# Altium project TYPEC_4KTransmitter-v1.0.PrjPcb (part 9 of 11)

## Sheet eMMC_SPI-FLASH_SHEET.SchDoc
size A4; SheetNumber: 19; SheetTotal: 23
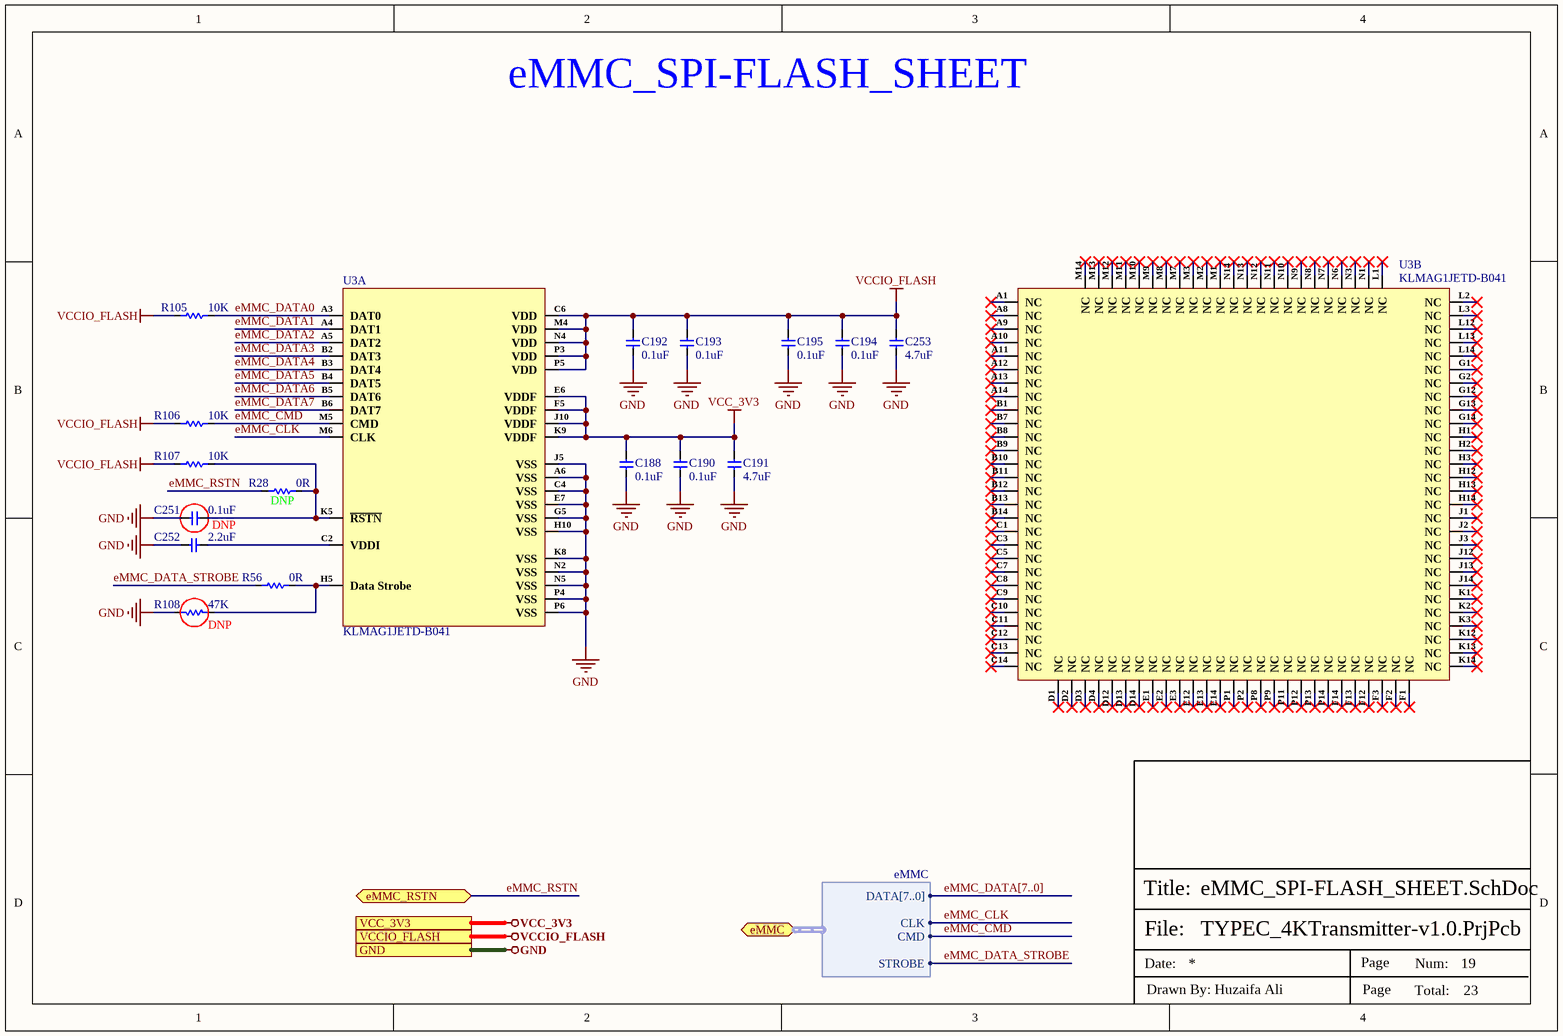
[diagram p19: eMMC_SPI-FLASH_SHEET.SchDoc]

### Parts
C188  0.1uF  [Cap-0402]
C190  0.1uF  [Cap-0402]
C191  4.7uF  [Cap-0402]
C192  0.1uF  [Cap-0402]
C193  0.1uF  [Cap-0402]
C194  0.1uF  [Cap-0402]
C195  0.1uF  [Cap-0402]
C251  0.1uF  [Cap-0402]
C252  2.2uF  [Cap-0402]
C253  4.7uF  [Cap-0402]
R28  DNP  [Res-0402]
R56  0R  [Res-0402]
R105  10K  [Res-0402]
R106  10K  [Res-0402]
R107  10K  [Res-0402]
R108  47K  [Res-0402]
U3  KLMAG1JETD-B041  [FBGA-153(11.5x13)]  (parts A,B of 2)

### Ports
eMMC (bidir, harness eMMC, see RK3566_FLASH-SD_SHEET[2C]), eMMC_RSTN (bidir, see RK3566_FLASH-SD_SHEET[2B]), GND (see DRAM_LPDDR4_SHEET[6D], HDMI2.0_SHEET[3D], POWER_LDO_SHEET[3D], POWER_OTHER_SHEET[3C], POWER_PMIC_RK809_CODEC[3C], POWER_PMIC_RK809_DC DC[3D], POWER_PMIC_RK809_LDO[4C], POWER_PMIC_RK809_MGM[3D], RK3566_AUDIO_SHEET[3C], RK3566_DDR-PHY_SHEET[5D], RK3566_FLASH-SD_SHEET[4C], RK3566_OSC_PMUIO_SHEET[5D], RK3566_POWER_SHEET[3D], RK3566_SARADC_GPIO[3D], RK3566_USB_PCIe_SHEET[3D], RK3566_VI_SHEET[3D], RK3566_VO_SHEET_1[3C], RK3566_VO_SHEET_2[4C], TYPE-C_INTERFACE_SHEET[3D], TYPE-C_TO_MIPI-CSI_SHEET[5D], USB2.0_SHEET[3D], WIFI-6_SHEET[3D]), VCC_3V3 (see HDMI2.0_SHEET[3D], POWER_PMIC_RK809_LDO[4C], RK3566_AUDIO_SHEET[3C], RK3566_SARADC_GPIO[3D], RK3566_USB_PCIe_SHEET[3D], RK3566_VI_SHEET[3D], RK3566_VO_SHEET_2[4C], TYPE-C_TO_MIPI-CSI_SHEET[5D], WIFI-6_SHEET[3D]), VCCIO_FLASH (see RK3566_FLASH-SD_SHEET[4C])

### Harnesses
eMMC: DATA[7..0], STROBE, CLK, CMD

### Nets
GND: C188.1 C190.1 C191.1 C192.1 C193.1 C194.1 C195.1 C251.2 C252.1 C253.1 R108.1 U3.A6(VSS) U3.C4(VSS) U3.E7(VSS) U3.G5(VSS) U3.H10(VSS) U3.J5(VSS) U3.K8(VSS) U3.N2(VSS) U3.N5(VSS) U3.P4(VSS) U3.P6(VSS) ; port GND
VCC_3V3: C188.2 C190.2 C191.2 U3.E6(VDDF) U3.F5(VDDF) U3.J10(VDDF) U3.K9(VDDF) ; port VCC_3V3
VCCIO_FLASH: C192.2 C193.2 C194.2 C195.2 C253.2 R105.1 R106.1 R107.1 U3.C6(VDD) U3.M4(VDD) U3.N4(VDD) U3.P3(VDD) U3.P5(VDD) ; port VCCIO_FLASH
eMMC_CLK: U3.M6(CLK) ; port eMMC.CLK
eMMC_CMD: R106.2 U3.M5(CMD) ; port eMMC.CMD
eMMC_DATA0: R105.2 U3.A3(DAT0)
eMMC_DATA1: U3.A4(DAT1)
eMMC_DATA2: U3.A5(DAT2)
eMMC_DATA3: U3.B2(DAT3)
eMMC_DATA4: U3.B3(DAT4)
eMMC_DATA5: U3.B4(DAT5)
eMMC_DATA6: U3.B5(DAT6)
eMMC_DATA7: U3.B6(DAT7)
eMMC_DATA_STROBE: R56.1 ; port eMMC.STROBE
eMMC_RSTN: R28.1 ; port eMMC_RSTN
NetC251_1: C251.1 R28.2 R107.2 U3.K5(~{RSTN})
NetC252_2: C252.2 U3.C2(VDDI)
NetR56_2: R56.2 R108.2 U3.H5(Data_Strobe)

Not connected (* = marked no-connect by the designer): U3 A1(NC)* A8(NC)* A9(NC)* A10(NC)* A11(NC)* A12(NC)* A13(NC)* A14(NC)* B1(NC)* B7(NC)* B8(NC)* B9(NC)* B10(NC)* B11(NC)* B12(NC)* B13(NC)* B14(NC)* C1(NC)* C3(NC)* C5(NC)* C7(NC)* C8(NC)* C9(NC)* C10(NC)* C11(NC)* C12(NC)* C13(NC)* C14(NC)* D1(NC)* D2(NC)* D3(NC)* D4(NC)* D12(NC)* D13(NC)* D14(NC)* E1(NC)* E2(NC)* E3(NC)* E12(NC)* E13(NC)* E14(NC)* F1(NC)* F2(NC)* F3(NC)* F12(NC)* F13(NC)* F14(NC)* G1(NC)* G2(NC)* G12(NC)* G13(NC)* G14(NC)* H1(NC)* H2(NC)* H3(NC)* H12(NC)* H13(NC)* H14(NC)* J1(NC)* J2(NC)* J3(NC)* J12(NC)* J13(NC)* J14(NC)* K1(NC)* K2(NC)* K3(NC)* K12(NC)* K13(NC)* K14(NC)* L1(NC)* L2(NC)* L3(NC)* L12(NC)* L13(NC)* L14(NC)* M1(NC)* M2(NC)* M3(NC)* M7(NC)* M8(NC)* M9(NC)* M10(NC)* M11(NC)* M12(NC)* M13(NC)* M14(NC)* N1(NC)* N3(NC)* N6(NC)* N7(NC)* N8(NC)* N9(NC)* N10(NC)* N11(NC)* N12(NC)* N13(NC)* N14(NC)* P1(NC)* P2(NC)* P8(NC)* P9(NC)* P11(NC)* P12(NC)* P13(NC)* P14(NC)*

### Buses and harness runs
bus eMMC_DATA[7..0]

### Notes on the sheet
- eMMC_SPI-FLASH_SHEET
- (near R28) 0R
- DNP
- (near R108) DNP
- File:
- Title:
- Date:
- Page
- Num:
- Total:
- Drawn By: Huzaifa Ali

### Library data of the parts
C188 C190 C192-C195 C251 = CC0402KRX5R6BB104: as C178 on sheet DRAM_LPDDR4_SHEET; Supplier 1: Digi-Key; Manufacturer Part Number: CC0402KRX5R6BB104; RoHS: Yes; Category: Ceramic Capacitors; Stock 1: 6385580; Pricing 1: 1=0.10000, 10=0.02700, 50=0.01500, 100=0.01220, 500=0.00874, 1000=0.00687, 2500=0.00625, 5000=0.00575 (USD); Mount: Surface Mount; Case/Package: 0402; Number of Pins: 2; Case Code (Imperial): 0402; Case Code (Metric): 1005; Min Operating Temperature: -55°C; Max Operating Temperature: 85°C; Dielectric: X5R; Packaging: Tape and Reel; Voltage Rating: 10V; Package Quantity: 1; Termination: SMD/SMT; Voltage Rating (DC): 10V; Series: CC; Length: 1mm; Width: 0.02inch; Height: 0.5mm; Depth: 0.5mm; Thickness: 0.022inch; Radiation Hardening: No; RoHS Compliant: Yes; REACH SVHC: No SVHC; Lead Free: Lead Free; Halogen Free: Halogen Free; ComponentLink1URL: https://datasheet.ciiva.com/144/mlccorderingcode-144029.pdf?src-supplier=Digi-Key; ComponentLink1Description: https://datasheet.ciiva.com/144/mlccorderingcode-144029.pdf?src-supplier=Digi-Key; ComponentLink2URL: https://datasheet.ciiva.com/144/mlccorderingcode-144028.pdf?src-supplier=Digi-Key; ComponentLink2Description: https://datasheet.ciiva.com/144/mlccorderingcode-144028.pdf?src-supplier=Digi-Key; ComponentLink3URL: https://datasheet.ciiva.com/144/mlccorderingcode-144030.pdf?src-supplier=Digi-Key; ComponentLink3Description: https://datasheet.ciiva.com/144/mlccorderingcode-144030.pdf?src-supplier=Digi-Key; ComponentLink4URL: https://datasheet.ciiva.com/7978/1359354-7978091.pdf?src-supplier=Element14; ComponentLink4Description: https://datasheet.ciiva.com/7978/1359354-7978091.pdf?src-supplier=Element14; ComponentLink5URL: https://datasheet.ciiva.com/11587/upy-gphc-x5r-4v-to-50v-12-11587302.pdf?src-supplier=Avnet; ComponentLink5Description: https://datasheet.ciiva.com/11587/upy-gphc-x5r-4v-to-50v-12-11587302.pdf?src-supplier=Avnet; Supplier Part Number 1: 311-1336-1-ND; LCSC Part Number: C129131
C191 C253 = CC0402KRX5R6BB475: CAP CER 4.7UF 10V X5R 0402; Manufacturer: Yageo; Tolerance: 10%; Supplier 1: Farnell; Manufacturer Part Number: CC0402KRX5R6BB475; RoHS: Yes; Category: Ceramic Capacitors; Stock 1: 20000; Pricing 1: 10000=0.02310, 50000=0.02100 (GBP); Mount: Surface Mount; Case/Package: 0402; Case Code (Imperial): 0402; Case Code (Metric): 1005; Min Operating Temperature: -55°C; Max Operating Temperature: 85°C; Packaging: Cut Tape; Capacitance: 4.7uF; Voltage Rating: 10V; RoHS Compliant: Yes; ComponentLink1URL: http://www.yageo.com/documents/recent/UPY-GPHC_X5R_4V-to-50V_25.pdf?src-supplier=Digi-Key; ComponentLink1Description: http://www.yageo.com/documents/recent/UPY-GPHC_X5R_4V-to-50V_25.pdf?src-supplier=Digi-Key; Supplier Part Number 1: 3871698; LCSC Part Number: C326586
C252 = C1005X5R0J225KTJA0E: CAP CER 2.2UF 6.3V X5R 0402; Manufacturer: TDK; Item Type: Capacitor; LCSC Part Number: C343036; Manufacturer Part Number: C1005X5R0J225KTJA0E; ComponentLink1Description: LCSC; ComponentLink1URL: https://www.lcsc.com/product-detail/Multilayer-Ceramic-Capacitors-MLCC-SMD-SMT_TDK-C1005X5R0J225KTJA0E_C343036.html
R28 = RC0402FR-070RL: RES 0 OHM JUMPER 1/16W 0402; Manufacturer: Yageo; Item Type: Resistors; Resistance: 0R; Tolerance: 1%; Power Rating: 62.5mW; Voltage Rating: 50V; Temperature Coefficient: 200ppm/°C; Max Power Dissipation: 63mW; Supplier 1: Mouser; Manufacturer Part Number: RC0402FR-070RL; RoHS: Yes; Stock 1: 8556842; Pricing 1: 1=0.10000, 10=0.01400, 50=0.01400, 100=0.00600, 1000=0.00300, 5000=0.00200, 10000=0.00100 (USD); Mount: Surface Mount; Case/Package: 0402; Contact Plating: Tin,Matte; Case Code (Imperial): 0402; Case Code (Metric): 1005; Size Code: 0402; Min Operating Temperature: -55°C; Max Operating Temperature: 155°C; Resistor Type: Thick Film; Packaging: Tape and Reel; Termination: SMD/SMT; Features: Moisture Resistant; Series: RC; Number of Terminations: 2; Length: 1mm; Width: 0.5mm; Height: 0.35mm; Radiation Hardening: No; Lead Free: Lead Free; RoHS Compliant: Yes; ComponentLink1URL: https://datasheet.ciiva.com/8896/pyu-rc0402-51-rohs-l-6-8896149.pdf?src-supplier=Avnet; ComponentLink1Description: https://datasheet.ciiva.com/8896/pyu-rc0402-51-rohs-l-6-8896149.pdf?src-supplier=Avnet; ComponentLink2URL: https://datasheet.ciiva.com/16790/pyu-rc0402-51-rohs-l-6-r-16790444.pdf?src-supplier=Future+Electronics; ComponentLink2Description: https://datasheet.ciiva.com/16790/pyu-rc0402-51-rohs-l-6-r-16790444.pdf?src-supplier=Future+Electronics; Supplier Part Number 1: 603-RC0402FR-070RL; LCSC Part Number: C106231
R56 = RC0402FR-070RL: as R29 on sheet RK3566_VO_SHEET_2; Supplier 1: Mouser; Manufacturer Part Number: RC0402FR-070RL; RoHS: Yes; Stock 1: 8556842; Pricing 1: 1=0.10000, 10=0.01400, 50=0.01400, 100=0.00600, 1000=0.00300, 5000=0.00200, 10000=0.00100 (USD); Mount: Surface Mount; Case/Package: 0402; Contact Plating: Tin,Matte; Case Code (Imperial): 0402; Case Code (Metric): 1005; Size Code: 0402; Min Operating Temperature: -55°C; Max Operating Temperature: 155°C; Resistance: 0R; Resistor Type: Thick Film; Packaging: Tape and Reel; Termination: SMD/SMT; Features: Moisture Resistant; Series: RC; Number of Terminations: 2; Length: 1mm; Width: 0.5mm; Height: 0.35mm; Radiation Hardening: No; Lead Free: Lead Free; RoHS Compliant: Yes; ComponentLink1URL: https://datasheet.ciiva.com/8896/pyu-rc0402-51-rohs-l-6-8896149.pdf?src-supplier=Avnet; ComponentLink1Description: https://datasheet.ciiva.com/8896/pyu-rc0402-51-rohs-l-6-8896149.pdf?src-supplier=Avnet; ComponentLink2URL: https://datasheet.ciiva.com/16790/pyu-rc0402-51-rohs-l-6-r-16790444.pdf?src-supplier=Future+Electronics; ComponentLink2Description: https://datasheet.ciiva.com/16790/pyu-rc0402-51-rohs-l-6-r-16790444.pdf?src-supplier=Future+Electronics; Supplier Part Number 1: 603-RC0402FR-070RL; LCSC Part Number: C106231
R105-R107 = RC0402FR-0710KL: RES 10K OHM 1% 1/16W 0402; Manufacturer: Yageo; Resistance: 10kR; Voltage Rating (DC): 50V; Temperature Coefficient: 100ppm/°C; Power Rating: 62.5mW; Max Power Dissipation: 63mW; Item Type: Resistor; Supplier 1: Mouser; Manufacturer Part Number: RC0402FR-0710KL; RoHS: Yes; Category: Chip SMD Resistors; Stock 1: 18648329; Pricing 1: 1=0.10000, 10=0.01400, 50=0.01400, 100=0.00500, 1000=0.00300, 10000=0.00200 (USD); Case/Package: 0402; Number of Pins: 2; Case Code (Imperial): 0402; Case Code (Metric): 1005; Min Operating Temperature: -55°C; Max Operating Temperature: 155°C; Resistor Type: Thick Film; Tolerance: 1%; Packaging: Tape and Reel; Voltage Rating: 50V; Termination: SMD/SMT; Working Voltage: 50V; Number of Terminations: 2; Features: Moisture Resistant; Series: RC; Resistance Tolerance: 1%; Construction: Rectangular; Length: 1mm; Width: 0.5mm; Height: 0.32mm; Depth: 0.5mm; Lead Pitch: 0.2mm; REACH SVHC: No SVHC; Lead Free: Lead Free; RoHS Compliant: Yes; Military Standard: Not; ComponentLink1URL: https://datasheet.ciiva.com/7660/38568-7660787.pdf?src-supplier=Element14; ComponentLink1Description: https://datasheet.ciiva.com/7660/38568-7660787.pdf?src-supplier=Element14; ComponentLink2URL: https://datasheet.ciiva.com/7849/1686128-7849814.pdf?src-supplier=Element14; ComponentLink2Description: https://datasheet.ciiva.com/7849/1686128-7849814.pdf?src-supplier=Element14; ComponentLink3URL: https://datasheet.ciiva.com/7983/1018594-7983486.pdf?src-supplier=Element14; ComponentLink3Description: https://datasheet.ciiva.com/7983/1018594-7983486.pdf?src-supplier=Element14; ComponentLink4URL: https://datasheet.ciiva.com/22747/1018594-22747512.pdf?src-supplier=Element14; ComponentLink4Description: https://datasheet.ciiva.com/22747/1018594-22747512.pdf?src-supplier=Element14; ComponentLink5URL: https://datasheet.ciiva.com/12667/pyu-rc0402-51-rohs-l-6-r-12667067.pdf?src-supplier=Mouser; ComponentLink5Description: https://datasheet.ciiva.com/12667/pyu-rc0402-51-rohs-l-6-r-12667067.pdf?src-supplier=Mouser; ComponentLink6URL: https://datasheet.ciiva.com/7849/1784430-7849813.pdf?src-supplier=Element14; ComponentLink6Description: https://datasheet.ciiva.com/7849/1784430-7849813.pdf?src-supplier=Element14; ComponentLink7URL: https://datasheet.ciiva.com/7849/1784430-7849815.pdf?src-supplier=Element14; ComponentLink7Description: https://datasheet.ciiva.com/7849/1784430-7849815.pdf?src-supplier=Element14; Supplier Part Number 1: 603-RC0402FR-0710KL; LCSC Part Number: C60490
R108 = RC0402FR-0747KL: RES 47K OHM 1% 1/16W 0402; Manufacturer: Yageo; Resistance: 47kR; Temperature Coefficient: 100ppm/°C; Voltage Rating: 50V; Power Rating: 62.5mW; Max Power Dissipation: 63mW; Item Type: Resistor; Supplier 1: Avnet; Manufacturer Part Number: RC0402FR-0747KL; RoHS: Yes; Category: Chip SMD Resistors; Stock 1: 680000; Pricing 1: 10000=0.00085, 20000=0.00087, 40000=0.00084, 60000=0.00083, 80000=0.00079, 100000=0.00078, 1000000=0.00076 (USD); Case/Package: 0402; Case Code (Imperial): 0402; Case Code (Metric): 1005; Min Operating Temperature: -55°C; Max Operating Temperature: 155°C; Resistor Type: Thick Film; Tolerance: 1%; Packaging: Tape and Reel; Termination: SMD/SMT; Number of Terminations: 2; Features: Moisture Resistant; Series: RC; Resistance Tolerance: 1%; Construction: Rectangular; Length: 1mm; Width: 0.02inch; Height: 0.016inch; Depth: 0.5mm; Lead Free: Lead Free; RoHS Compliant: Yes; Military Standard: Not; ComponentLink1URL: https://datasheet.ciiva.com/46412/1018594-46412839.pdf?src-supplier=Element14; ComponentLink1Description: https://datasheet.ciiva.com/46412/1018594-46412839.pdf?src-supplier=Element14; ComponentLink2URL: https://datasheet.ciiva.com/2453/pyu-r-int-thick-7-2453389.pdf?src-supplier=Digi-Key; ComponentLink2Description: https://datasheet.ciiva.com/2453/pyu-r-int-thick-7-2453389.pdf?src-supplier=Digi-Key; ComponentLink3URL: https://datasheet.ciiva.com/2453/pyu-r-int-thick-7-2453390.pdf?src-supplier=Digi-Key; ComponentLink3Description: https://datasheet.ciiva.com/2453/pyu-r-int-thick-7-2453390.pdf?src-supplier=Digi-Key; ComponentLink4URL: https://datasheet.ciiva.com/2453/pyu-r-int-thick-7-2453388.pdf?src-supplier=Digi-Key; ComponentLink4Description: https://datasheet.ciiva.com/2453/pyu-r-int-thick-7-2453388.pdf?src-supplier=Digi-Key; ComponentLink5URL: https://datasheet.ciiva.com/15189/getdatasheetpartid-323748-15189466.pdf?src-supplier=Verical; ComponentLink5Description: https://datasheet.ciiva.com/15189/getdatasheetpartid-323748-15189466.pdf?src-supplier=Verical; ComponentLink6URL: https://datasheet.ciiva.com/16793/pyu-rc0402-51-rohs-l-6-r-16793430.pdf?src-supplier=Future+Electronics; ComponentLink6Description: https://datasheet.ciiva.com/16793/pyu-rc0402-51-rohs-l-6-r-16793430.pdf?src-supplier=Future+Electronics; Supplier Part Number 1: RC0402FR-0747KL; LCSC Part Number: C93943; Size Code: 0402; Package Quantity: 1
U3 = KLMAG1JETD-B041: eMMC 5.1 FBGA-153 eMMC ROHS; Manufacturer: Samsung; Item Type: IC; Manufacturer Part Number: KLMAG1JETD-B041; Package: FBGA-153; LCSC Part Number: C499919; ComponentLink1Description: LCSC; ComponentLink1URL: https://www.lcsc.com/product-detail/eMMC_Samsung-KLMAG1JETD-B041_C499919.html

## Sheet TYPE-C_TO_MIPI-CSI_SHEET.SchDoc
size 420 x 297 mm; SheetNumber: 20; SheetTotal: 23
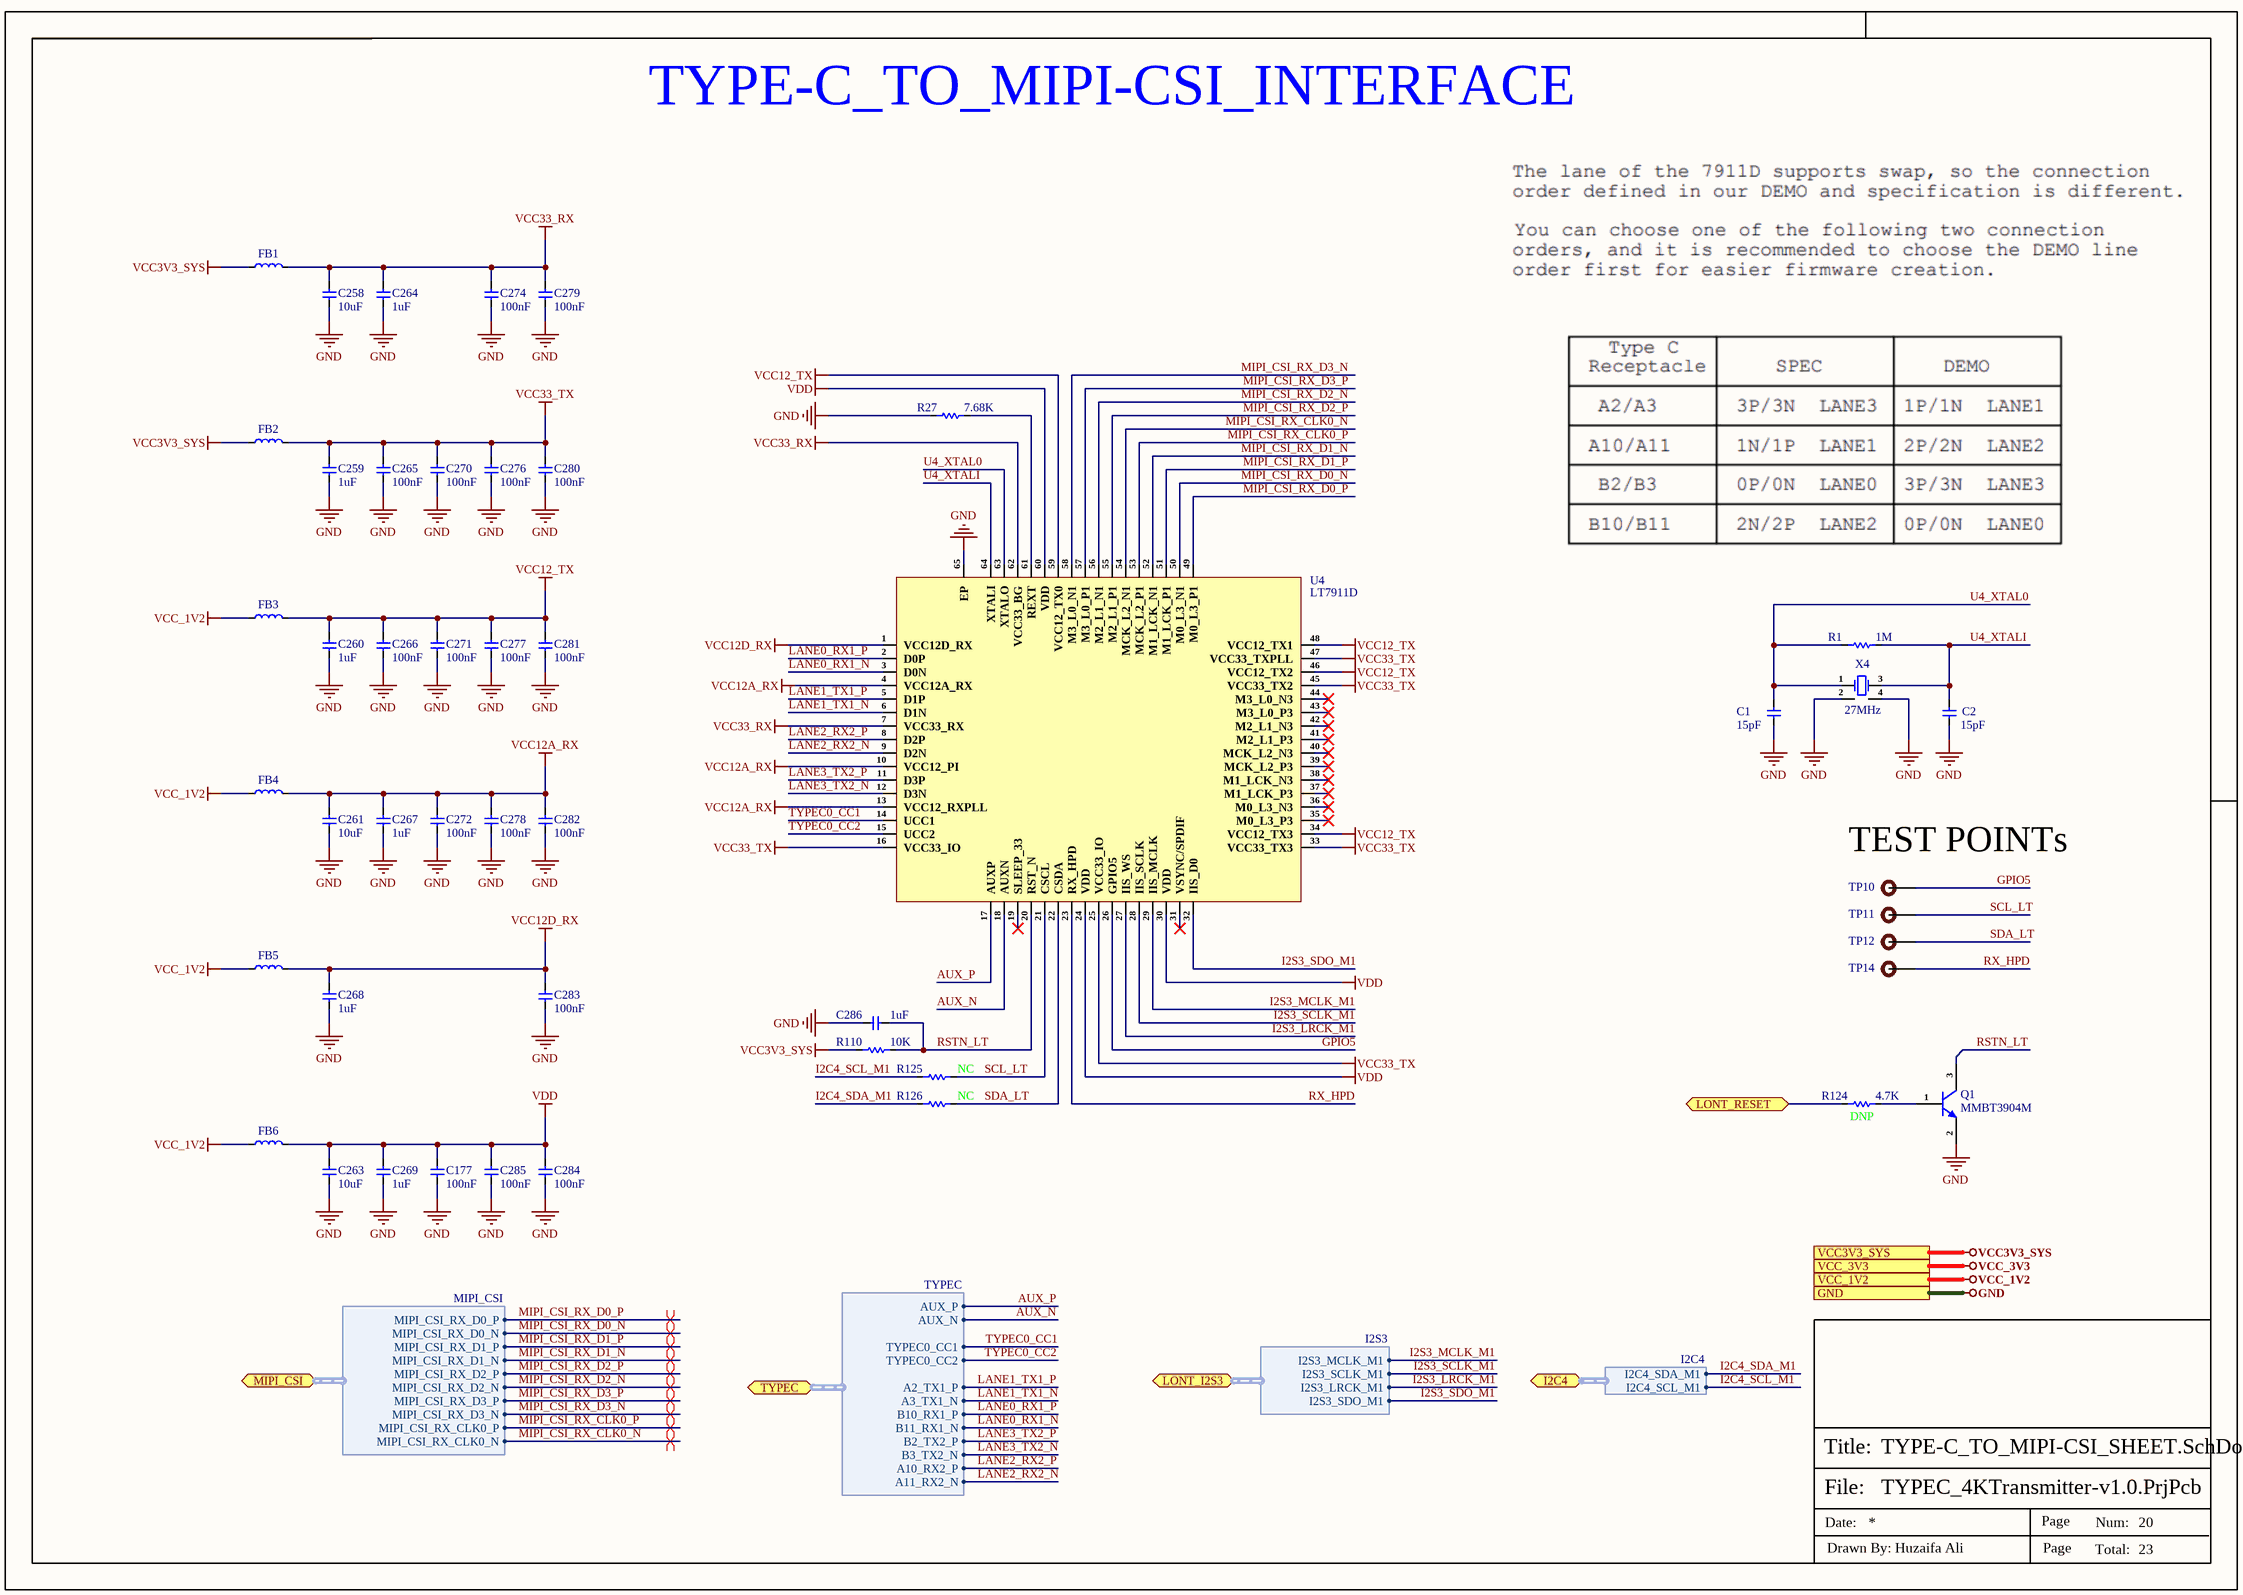
[diagram p20: TYPE-C_TO_MIPI-CSI_SHEET.SchDoc]

### Parts
C1  15pF  [Cap-0402]
C2  15pF  [Cap-0402]
C177  100nF  [CAP-0201]
C258  10uF  [Cap-0402]
C259  1uF  [Cap-0402]
C260  1uF  [Cap-0402]
C261  10uF  [Cap-0402]
C263  10uF  [Cap-0402]
C264  1uF  [Cap-0402]
C265  100nF  [CAP-0201]
C266  100nF  [CAP-0201]
C267  1uF  [Cap-0402]
C268  1uF  [CAP-0201]
C269  1uF  [CAP-0201]
C270  100nF  [CAP-0201]
C271  100nF  [CAP-0201]
C272  100nF  [CAP-0201]
C274  100nF  [CAP-0201]
C276  100nF  [CAP-0201]
C277  100nF  [CAP-0201]
C278  100nF  [CAP-0201]
C279  100nF  [CAP-0201]
C280  100nF  [CAP-0201]
C281  100nF  [CAP-0201]
C282  100nF  [CAP-0201]
C283  100nF  [CAP-0201]
C284  100nF  [CAP-0201]
C285  100nF  [CAP-0201]
C286  1uF  [CAP-0201]
FB1  BLM18SG221TN1D  [IND-0603 (1608 Metric)]  (value not drawn)
FB2  BLM18SG221TN1D  [IND-0603 (1608 Metric)]  (value not drawn)
FB3  BLM18SG221TN1D  [IND-0603 (1608 Metric)]  (value not drawn)
FB4  BLM18SG221TN1D  [IND-0603 (1608 Metric)]  (value not drawn)
FB5  BLM18SG221TN1D  [IND-0603 (1608 Metric)]  (value not drawn)
FB6  BLM18SG221TN1D  [IND-0603 (1608 Metric)]  (value not drawn)
Q1  MMBT3904M  [SOT-723]
R1  1M  [Res-0402]
R27  7.68K  [Res-0402]
R110  10K  [Res-0201]
R124  DNP  [Res-0402]
R125  NC  [Res-0402]
R126  NC  [Res-0402]
TP10  TEST POINT 0.5mm Dia  [Test-point - 0.5mm]  (value not drawn)  (no BOM)
TP11  TEST POINT 0.5mm Dia  [Test-point - 0.5mm]  (value not drawn)  (no BOM)
TP12  TEST POINT 0.5mm Dia  [Test-point - 0.5mm]  (value not drawn)  (no BOM)
TP14  TEST POINT 0.5mm Dia  [Test-point - 0.5mm]  (value not drawn)  (no BOM)
U4  LT7911D  [QFN-64-EP(7.5x7.5)]
X4  27MHz  [SMD2520-4P]

### Ports
GND (see DRAM_LPDDR4_SHEET[6D], eMMC_SPI-FLASH_SHEET[1D], HDMI2.0_SHEET[3D], POWER_LDO_SHEET[3D], POWER_OTHER_SHEET[3C], POWER_PMIC_RK809_CODEC[3C], POWER_PMIC_RK809_DC DC[3D], POWER_PMIC_RK809_LDO[4C], POWER_PMIC_RK809_MGM[3D], RK3566_AUDIO_SHEET[3C], RK3566_DDR-PHY_SHEET[5D], RK3566_FLASH-SD_SHEET[4C], RK3566_OSC_PMUIO_SHEET[5D], RK3566_POWER_SHEET[3D], RK3566_SARADC_GPIO[3D], RK3566_USB_PCIe_SHEET[3D], RK3566_VI_SHEET[3D], RK3566_VO_SHEET_1[3C], RK3566_VO_SHEET_2[4C], TYPE-C_INTERFACE_SHEET[3D], USB2.0_SHEET[3D], WIFI-6_SHEET[3D]), I2C4 (bidir, harness I2C4, see RK3566_VI_SHEET[1D]), LONT_I2S3 (bidir, harness I2S3, see RK3566_AUDIO_SHEET[3B]), LONT_RESET (bidir, see RK3566_VI_SHEET[3B]), MIPI_CSI (bidir, harness MIPI_CSI, see RK3566_VI_SHEET[1D]), TYPEC (bidir, harness TYPEC, see TYPE-C_INTERFACE_SHEET[1D]), VCC3V3_SYS (see DRAM_LPDDR4_SHEET[6D], POWER_LDO_SHEET[3D], POWER_OTHER_SHEET[3C], POWER_PMIC_RK809_DC DC[3D], POWER_PMIC_RK809_LDO[4C], POWER_PMIC_RK809_MGM[3D], RK3566_SARADC_GPIO[3D], WIFI-6_SHEET[3D]), VCC_1V2 (see POWER_OTHER_SHEET[3C]), VCC_3V3 (see eMMC_SPI-FLASH_SHEET[1D], HDMI2.0_SHEET[3D], POWER_PMIC_RK809_LDO[4C], RK3566_AUDIO_SHEET[3C], RK3566_SARADC_GPIO[3D], RK3566_USB_PCIe_SHEET[3D], RK3566_VI_SHEET[3D], RK3566_VO_SHEET_2[4C], WIFI-6_SHEET[3D])

### Harnesses
MIPI_CSI: MIPI_CSI_RX_D0_P, MIPI_CSI_RX_D0_N, MIPI_CSI_RX_D1_P, MIPI_CSI_RX_D1_N, MIPI_CSI_RX_D2_P, MIPI_CSI_RX_D2_N, MIPI_CSI_RX_D3_P, MIPI_CSI_RX_D3_N, MIPI_CSI_RX_CLK0_P, MIPI_CSI_RX_CLK0_N
TYPEC: TYPEC0_CC1, TYPEC0_CC2, AUX_N, AUX_P, A2_TX1_P, A3_TX1_N, B11_RX1_N, B10_RX1_P, B3_TX2_N, B2_TX2_P, A10_RX2_P, A11_RX2_N
I2S3: I2S3_MCLK_M1, I2S3_SCLK_M1, I2S3_LRCK_M1, I2S3_SDO_M1
I2C4: I2C4_SDA_M1, I2C4_SCL_M1

### Nets
GND: C1.1 C2.1 C177.1 C258.1 C259.1 C260.1 C261.1 C263.1 C264.1 C265.1 C266.1 C267.1 C268.1 C269.1 C270.1 C271.1 C272.1 C274.1 C276.1 C277.1 C278.1 C279.1 C280.1 C281.1 C282.1 C283.1 C284.1 C285.1 C286.1 Q1.2(E) R27.2 U4.65(EP) X4.2(GND) X4.4(GND) ; port GND
VCC3V3_SYS: FB1.1 FB2.1 R110.1 ; port VCC3V3_SYS
VCC12_TX: C260.2 C266.2 C271.2 C277.2 C281.2 FB3.2 U4.34(VCC12_TX3) U4.46(VCC12_TX2) U4.48(VCC12_TX1) U4.59(VCC12_TX0)
VCC12A_RX: C261.2 C267.2 C272.2 C278.2 C282.2 FB4.2 U4.4(VCC12A_RX) U4.10(VCC12_PI) U4.13(VCC12_RXPLL)
VCC12D_RX: C268.2 C283.2 FB5.2 U4.1(VCC12D_RX)
VCC33_RX: C258.2 C264.2 C274.2 C279.2 FB1.2 U4.7(VCC33_RX) U4.62(VCC33_BG)
VCC33_TX: C259.2 C265.2 C270.2 C276.2 C280.2 FB2.2 U4.16(VCC33_IO) U4.25(VCC33_IO) U4.33(VCC33_TX3) U4.45(VCC33_TX2) U4.47(VCC33_TXPLL)
VCC_1V2: FB3.1 FB4.1 FB5.1 FB6.1 ; port VCC_1V2
VDD: C177.2 C263.2 C269.2 C284.2 C285.2 FB6.2 U4.24(VDD) U4.30(VDD) U4.60(VDD)
AUX_N: U4.18(AUXN) ; port TYPEC.AUX_N
AUX_P: U4.17(AUXP) ; port TYPEC.AUX_P
GPIO5: TP10.1 U4.26(GPIO5)
I2C4_SCL_M1: R125.1 ; port I2C4.I2C4_SCL_M1
I2C4_SDA_M1: R126.1 ; port I2C4.I2C4_SDA_M1
I2S3_LRCK_M1: U4.27(IIS_WS) ; port LONT_I2S3.I2S3_LRCK_M1
I2S3_MCLK_M1: U4.29(IIS_MCLK) ; port LONT_I2S3.I2S3_MCLK_M1
I2S3_SCLK_M1: U4.28(IIS_SCLK) ; port LONT_I2S3.I2S3_SCLK_M1
I2S3_SDO_M1: U4.32(IIS_D0) ; port LONT_I2S3.I2S3_SDO_M1
LANE0_RX1_N: U4.3(D0N) ; port TYPEC.B11_RX1_N
LANE0_RX1_P: U4.2(D0P) ; port TYPEC.B10_RX1_P
LANE1_TX1_N: U4.6(D1N) ; port TYPEC.A3_TX1_N
LANE1_TX1_P: U4.5(D1P) ; port TYPEC.A2_TX1_P
LANE2_RX2_N: U4.9(D2N) ; port TYPEC.A11_RX2_N
LANE2_RX2_P: U4.8(D2P) ; port TYPEC.A10_RX2_P
LANE3_TX2_N: U4.12(D3N) ; port TYPEC.B3_TX2_N
LANE3_TX2_P: U4.11(D3P) ; port TYPEC.B2_TX2_P
MIPI_CSI_RX_CLK0_N: U4.54(MCK_L2_N1) ; port MIPI_CSI.MIPI_CSI_RX_CLK0_N
MIPI_CSI_RX_CLK0_P: U4.53(MCK_L2_P1) ; port MIPI_CSI.MIPI_CSI_RX_CLK0_P
MIPI_CSI_RX_D0_N: U4.50(M0_L3_N1) ; port MIPI_CSI.MIPI_CSI_RX_D0_N
MIPI_CSI_RX_D0_P: U4.49(M0_L3_P1) ; port MIPI_CSI.MIPI_CSI_RX_D0_P
MIPI_CSI_RX_D1_N: U4.52(M1_LCK_N1) ; port MIPI_CSI.MIPI_CSI_RX_D1_N
MIPI_CSI_RX_D1_P: U4.51(M1_LCK_P1) ; port MIPI_CSI.MIPI_CSI_RX_D1_P
MIPI_CSI_RX_D2_N: U4.56(M2_L1_N1) ; port MIPI_CSI.MIPI_CSI_RX_D2_N
MIPI_CSI_RX_D2_P: U4.55(M2_L1_P1) ; port MIPI_CSI.MIPI_CSI_RX_D2_P
MIPI_CSI_RX_D3_N: U4.58(M3_L0_N1) ; port MIPI_CSI.MIPI_CSI_RX_D3_N
MIPI_CSI_RX_D3_P: U4.57(M3_L0_P1) ; port MIPI_CSI.MIPI_CSI_RX_D3_P
RSTN_LT: C286.2 Q1.3(C) R110.2 U4.20(RST_N)
RX_HPD: TP14.1 U4.23(RX_HPD)
SCL_LT: R125.2 TP11.1 U4.21(CSCL)
SDA_LT: R126.2 TP12.1 U4.22(CSDA)
TYPEC0_CC1: U4.14(UCC1) ; port TYPEC.TYPEC0_CC1
TYPEC0_CC2: U4.15(UCC2) ; port TYPEC.TYPEC0_CC2
U4_XTAL0: C1.2 R1.1 U4.63(XTALO) X4.1(OSC1)
U4_XTALI: C2.2 R1.2 U4.64(XTALI) X4.3(OSC2)
NetQ1_1: Q1.1(B) R124.2
NetR27_1: R27.1 U4.61(REXT)
NetR124_1: R124.1 ; port LONT_RESET

Not connected (* = marked no-connect by the designer): U4 19(SLEEP_33)* 31(VSYNC/SPDIF)* 35(M0_L3_P3)* 36(M0_L3_N3)* 37(M1_LCK_P3)* 38(M1_LCK_N3)* 39(MCK_L2_P3)* 40(MCK_L2_N3)* 41(M2_L1_P3)* 42(M2_L1_N3)* 43(M3_L0_P3)* 44(M3_L0_N3)*

### Layout directives
differential pair; differential pair class MIPI_LINES_100; rule Matched Net Lengths [Tolerance = 0.508mm]; rule Impedance Constraint [Min = 98.00    Max = 102.0    ]: MIPI_CSI_RX_CLK0_N, MIPI_CSI_RX_CLK0_P, MIPI_CSI_RX_D0_N, MIPI_CSI_RX_D0_P, MIPI_CSI_RX_D1_N, MIPI_CSI_RX_D1_P, MIPI_CSI_RX_D2_N, MIPI_CSI_RX_D2_P, MIPI_CSI_RX_D3_N, MIPI_CSI_RX_D3_P

### Notes on the sheet
- TYPE-C_TO_MIPI-CSI_INTERFACE
- (near TP10) TEST POINTs
- (near R124) 4.7K
- File:
- Title:
- Date:
- Page
- Num:
- Total:
- Drawn By: Huzaifa Ali

### Library data of the parts
C1 C2 = CQ0402GRNPO9BN150: CAP CER 15PF 50V C0G/NPO 0402; Manufacturer: Yageo; Tolerance: 2%; Dielectric: C0G; Item Type: Capacitors; Manufacturer Part Number: CQ0402GRNPO9BN150; RoHS: Yes; Mounting Technology: Surface Mount; Case/Package: 0402; Case Code (Metric): 1005; Case Code (Imperial): 0402; Min Operating Temperature: -55°C; Max Operating Temperature: 125°C; Value: 15pF; Series: CQ; Packaging: Tape and Reel; Package Quantity: 10000; Voltage Rating: 50V; ComponentLink1URL: http://www.mouser.com/ds/2/447/UPY-High%20Q_NP0_16V-to-250V_11-533944.pdf?src-supplier=Mouser; ComponentLink1Description: http://www.mouser.com/ds/2/447/UPY-High%20Q_NP0_16V-to-250V_11-533944.pdf?src-supplier=Mouser; ComponentLink2URL: http://www.yageo.com/documents/recent/UPY-High%20Q_NP0_16V-to-250V_13.pdf?src-supplier=Digikey; ComponentLink2Description: http://www.yageo.com/documents/recent/UPY-High%20Q_NP0_16V-to-250V_13.pdf?src-supplier=Digikey; LCSC Part Number: C577406; Supplier: Digikey; Pricing: 10000=0.04366 (USD); Weight: 2.3E-05oz; Voltage Rating (DC): 50V
C177 C265 C266 C270-C272 C274 C276-C285 = CC0201KRX5R6BB104: as C151 on sheet RK3566_VO_SHEET_2; Supplier 1: Mouser; Manufacturer Part Number: CC0201KRX5R6BB104; RoHS: Yes; Category: Ceramic Capacitors; Stock 1: 824403; Pricing 1: 1=0.10000, 10=0.02400, 50=0.02400, 100=0.01900, 1000=0.01100, 10000=0.00900 (USD); Mount: Surface Mount; Case/Package: 0201; Case Code (Imperial): 0201; Case Code (Metric): 0603; Weight: 6E-06oz; Min Operating Temperature: -55°C; Max Operating Temperature: 85°C; Capacitance: 100nF; Dielectric: X5R; Voltage Rating (DC): 10V; Packaging: Tape and Reel; Termination: SMD/SMT; Resistor Type: Ceramic; Voltage Rating: 10V; Series: CC; Construction: Flat; Length: 0.6mm; Width: 0.012inch; Height: 0.3mm; Thickness: 0.013inch; Depth: 0.3mm; Radiation Hardening: No; Lead Free: Lead Free; Halogen Free: Halogen Free; RoHS Compliant: Yes; ComponentLink1URL: https://datasheet.ciiva.com/11587/upy-gphc-x5r-4v-to-50v-12-11587190.pdf?src-supplier=Avnet; ComponentLink1Description: https://datasheet.ciiva.com/11587/upy-gphc-x5r-4v-to-50v-12-11587190.pdf?src-supplier=Avnet; Supplier Part Number 1: 603-CC201KRX5R6BB104; LCSC Part Number: C190183
C258 C261 C263 = CL05A106MP5NUNC: CAP CER 10UF 10V X5R 0402; Manufacturer: Samsung; Tolerance: 20%; Item Type: Capacitor; Supplier 1: Avnet; Manufacturer Part Number: CL05A106MP5NUNC; RoHS: Yes; Category: Ceramic Capacitors; Stock 1: 1729850; Pricing 1: 10000=0.02537 (USD); Mount: Surface Mount; Case/Package: 0402; Case Code (Metric): 1005; Case Code (Imperial): 0402; Min Operating Temperature: -55°C; Max Operating Temperature: 85°C; Capacitance: 10uF; Dielectric: X5R; Packaging: Tape and Reel; Package Quantity: 1; Voltage Rating: 10V; Termination: Wraparound; Series: CL; Length: 1mm; Width: 0.02inch; Thickness: 0.028inch; Depth: 0.5mm; Radiation Hardening: No; Lead Free: Lead Free; RoHS Compliant: Yes; ComponentLink1URL: https://datasheet.ciiva.com/25721/cl05a106mp5nunc-25721584.pdf?src-supplier=Digi-Key; ComponentLink1Description: https://datasheet.ciiva.com/25721/cl05a106mp5nunc-25721584.pdf?src-supplier=Digi-Key; ComponentLink2URL: https://datasheet.ciiva.com/26838/getdatasheetpartid-745310-26838170.pdf?src-supplier=Verical; ComponentLink2Description: https://datasheet.ciiva.com/26838/getdatasheetpartid-745310-26838170.pdf?src-supplier=Verical; Supplier Part Number 1: CL05A106MP5NUNC; LCSC Part Number: C315248; Contact Plating: Tin; Construction: Flat
C259 C260 C264 C267 = CC0402KRX5R6BB105: as C204 on sheet DRAM_LPDDR4_SHEET; Supplier 1: Mouser; Manufacturer Part Number: CC0402KRX5R6BB105; RoHS: Yes; Category: Ceramic Capacitors; Stock 1: 6711367; Pricing 1: 1=0.11000, 10=0.05500, 50=0.05500, 100=0.03300, 500=0.02700, 1000=0.02200, 2500=0.02100, 10000=0.01800 (USD); Mount: Surface Mount; Case/Package: 0402; Number of Pins: 2; Case Code (Metric): 1005; Case Code (Imperial): 0402; Min Operating Temperature: -55°C; Max Operating Temperature: 85°C; Capacitance: 1uF; Dielectric: X5R; Package Quantity: 1; Voltage Rating: 10V; Packaging: Tape and Reel; Voltage Rating (DC): 10V; Termination: SMD/SMT; Resistor Type: Ceramic; Series: CC; Construction: Flat; Length: 1mm; Width: 0.02inch; Height: 0.5mm; Thickness: 0.022inch; Depth: 0.5mm; Radiation Hardening: No; REACH SVHC: No SVHC; Lead Free: Lead Free; Halogen Free: Halogen Free; RoHS Compliant: Yes; ComponentLink1URL: https://datasheet.ciiva.com/176/upy-gphc-x5r-4v-to-50v-12-176704.pdf?src-supplier=Digi-Key; ComponentLink1Description: https://datasheet.ciiva.com/176/upy-gphc-x5r-4v-to-50v-12-176704.pdf?src-supplier=Digi-Key; ComponentLink2URL: https://datasheet.ciiva.com/176/mlccorderingcode-176705.pdf?src-supplier=Digi-Key; ComponentLink2Description: https://datasheet.ciiva.com/176/mlccorderingcode-176705.pdf?src-supplier=Digi-Key; ComponentLink3URL: https://datasheet.ciiva.com/176/mlccorderingcode-176706.pdf?src-supplier=Digi-Key; ComponentLink3Description: https://datasheet.ciiva.com/176/mlccorderingcode-176706.pdf?src-supplier=Digi-Key; Supplier Part Number 1: 603-CC402KRX5R6BB105; LCSC Part Number: C106254
C268 C269 C286 = CC0201MRX5R6BB105: CAP CER 1UF 10V X5R 0201; Manufacturer: Yageo; Item Type: Capacitor; Manufacturer Part Number: CC0201MRX5R6BB105; RoHS: Yes; Category: Ceramic Capacitors; ComponentLink1URL: https://datasheet.octopart.com/CC0201MRX5R6BB105-Yageo-datasheet-158238148.pdf?src-supplier=Farnell; ComponentLink1Description: https://datasheet.octopart.com/CC0201MRX5R6BB105-Yageo-datasheet-158238148.pdf?src-supplier=Farnell; ComponentLink2URL: http://www.yageo.com/documents/recent/UPY-GPHC_X5R_4V-to-50V_25.pdf?src-supplier=Digi-Key; ComponentLink2Description: http://www.yageo.com/documents/recent/UPY-GPHC_X5R_4V-to-50V_25.pdf?src-supplier=Digi-Key; ComponentLink3URL: https://datasheet.octopart.com/CC0201MRX5R6BB105-Yageo-datasheet-137700082.pdf?src-supplier=Future+Electronics; ComponentLink3Description: https://datasheet.octopart.com/CC0201MRX5R6BB105-Yageo-datasheet-137700082.pdf?src-supplier=Future+Electronics; LCSC Part Number: C605210; Supplier: Digi-Key; Supplier Part Number: 311-3474-1-ND; Stock: 772400; Pricing: 1=0.19, 10=0.135, 50=0.0764, 100=0.0633, 500=0.04436, 1000=0.03672, 2500=0.03418, 5000=0.03127 (USD)
FB1-FB6 = BLM18SG221TN1D: FERRITE BEAD 220 OHM 0603 1LN; Manufacturer: Murata; Current Rating: 2.5A; Tolerance: 25%; Impedance: 220R; DC Resistance (DCR): 40mR; Test Frequency: 100MHz; Number of Lines: 1; Item Type: Ferrite Beads; Material: Steel,Ferrite; Supplier: Future Electronics; Manufacturer Part Number: BLM18SG221TN1D; RoHS: Yes; Stock: 60000; Pricing: 10000=0.0299, 20000=0.0294, 30000=0.0292, 40000=0.029, 50000=0.0284 (USD); Case/Package: 0603; Pins: 2; Case Code (Imperial): 0603; Core Material: Ferrite; Case Code (Metric): 1608; Packaging: Tape and Reel; Package Quantity: 1; Max DC Current: 2.5A; Series: BLM18S; Max Current Rating: 2.5A; RMS Current (Irms): 2.5A; ESR: 40mR; Length: 1.6mm; Width: 0.8mm; Height: 0.8mm; Lead Free: Lead Free; RoHS Compliant: Yes; Reach SVHC Compliant: No; ComponentLink1URL: https://datasheet.ciiva.com/1561/c31e-1561456.pdf?src-supplier=Newark; ComponentLink1Description: https://datasheet.ciiva.com/1561/c31e-1561456.pdf?src-supplier=Newark; ComponentLink2URL: https://datasheet.ciiva.com/41449/001171724-da-01-en-chip-drossel0603-220r-2500ma-1-6x0-8mm-41449352.pdf?src-supplier=Conrad; ComponentLink2Description: https://datasheet.ciiva.com/41449/001171724-da-01-en-chip-drossel0603-220r-2500ma-1-6x0-8mm-41449352.pdf?src-supplier=Conrad; ComponentLink3URL: https://datasheet.ciiva.com/41449/001172313-da-01-en-drossel-0603-220r-21-6x0-8mm-10000st-41449677.pdf?src-supplier=Conrad; ComponentLink3Description: https://datasheet.ciiva.com/41449/001172313-da-01-en-drossel-0603-220r-21-6x0-8mm-10000st-41449677.pdf?src-supplier=Conrad; ComponentLink4URL: https://datasheet.ciiva.com/14122/blm-series-eng-tds-14122910.pdf?src-supplier=Distrelec; ComponentLink4Description: https://datasheet.ciiva.com/14122/blm-series-eng-tds-14122910.pdf?src-supplier=Distrelec; LCSC Part Number: C88988; Weight: 7.1E-05oz; Min Operating Temperature: -55°C; Max Operating Temperature: 125°C; Termination: SMD/SMT; DC Current: 2.5A; Number of Circuits: 1; DC Resistance-Max: 40mR; Depth: 0.95mm; Radiation Hardening: No; ComponentLink5URL: https://datasheet.ciiva.com/8508/l0110s0100blm18s-8508310.pdf?src-supplier=Avnet; ComponentLink5Description: https://datasheet.ciiva.com/8508/l0110s0100blm18s-8508310.pdf?src-supplier=Avnet; ComponentLink6URL: https://datasheet.ciiva.com/8021/5151-8021517.pdf?src-supplier=Element14; ComponentLink6Description: https://datasheet.ciiva.com/8021/5151-8021517.pdf?src-supplier=Element14; ComponentLink7URL: https://datasheet.ciiva.com/8021/5151-8021519.pdf?src-supplier=Element14; ComponentLink7Description: https://datasheet.ciiva.com/8021/5151-8021519.pdf?src-supplier=Element14; ComponentLink8URL: https://datasheet.ciiva.com/1012/l0110s0100blm18s-1012627.pdf?src-supplier=Digikey; ComponentLink8Description: https://datasheet.ciiva.com/1012/l0110s0100blm18s-1012627.pdf?src-supplier=Digikey; ComponentLink9URL: https://datasheet.ciiva.com/1012/l0110s0100blm18s-1012626.pdf?src-supplier=Digikey; ComponentLink9Description: https://datasheet.ciiva.com/1012/l0110s0100blm18s-1012626.pdf?src-supplier=Digikey; ComponentLink10URL: https://datasheet.ciiva.com/1012/l0110s0100blm18s-1012628.pdf?src-supplier=Digikey; ComponentLink10Description: https://datasheet.ciiva.com/1012/l0110s0100blm18s-1012628.pdf?src-supplier=Digikey; ComponentLink11URL: https://datasheet.ciiva.com/16204/l0110s0100blm18s-16204029.pdf?src-supplier=Future+Electronics; ComponentLink11Description: https://datasheet.ciiva.com/16204/l0110s0100blm18s-16204029.pdf?src-supplier=Future+Electronics
Q1 = MMBT3904M: 40V 100mW 100@10mA,1V 200mA 300MHz 300mV@50mA,5mA NPN -55℃~+150℃@(Tj) SOT-723 Bipolar Transistors - BJT ROHS; Manufacturer: TECH PUBLIC; Item Type: Mosfet; ComponentLink1Description: LCSC; ComponentLink1URL: https://www.lcsc.com/product-detail/Bipolar-Transistors-BJT_TECH-PUBLIC-MMBT3904M_C2923360.html; Manufacturer Part Number: MMBT3904M; Package: SOT-723; LCSC Part Number: C2923360
R1 = RC0402FR-071ML: RES 1M OHM 1% 1/16W 0402; Manufacturer: Yageo; Value: 1MR; Power Rating: 63mW; Voltage Rating: 50V; Temperature Coefficient: 100ppm/°C; Item Type: Resistor; Supplier: Digikey; Supplier Part Number: 311-1.00MLRCT-ND; Manufacturer Part Number: RC0402FR-071ML; RoHS: Yes; Category: Chip SMD Resistors; Stock: 6516; Pricing: 1=0.1, 10=0.015, 50=0.0088, 100=0.0073, 500=0.00488, 1000=0.00417, 5000=0.00297 (USD); Case/Package: 0402; Case Code (Imperial): 0402; Case Code (Metric): 1005; Min Operating Temperature: -55°C; Max Operating Temperature: 155°C; Resistor Type: Thick Film; Packaging: Tape and Reel; Tolerance: 1%; Termination: SMD/SMT; Features: Moisture Resistant; Series: RC; Max Power Dissipation: 63mW; Number of Terminations: 2; Resistance Tolerance: 1%; Construction: Rectangular; Technology: THICK FILM; Voltage Rating (AC): 50V; Length: 1mm; Height: 0.32mm; Depth: 0.5mm; RoHS Compliant: Yes; Military Standard: Not; Reach SVHC Compliant: Unknown; Lead Free: 5697LeadFree; ComponentLink1URL: https://datasheet.ciiva.com/11808/0900766b80c66297-11808125.pdf?src-supplier=Rs; ComponentLink1Description: https://datasheet.ciiva.com/11808/0900766b80c66297-11808125.pdf?src-supplier=Rs; ComponentLink2URL: https://datasheet.ciiva.com/46394/1018594-46394951.pdf?src-supplier=Element14; ComponentLink2Description: https://datasheet.ciiva.com/46394/1018594-46394951.pdf?src-supplier=Element14; ComponentLink3URL: https://datasheet.ciiva.com/7849/1018594-7849883.pdf?src-supplier=Element14; ComponentLink3Description: https://datasheet.ciiva.com/7849/1018594-7849883.pdf?src-supplier=Element14; ComponentLink4URL: https://datasheet.ciiva.com/7849/1018594-7849882.pdf?src-supplier=Element14; ComponentLink4Description: https://datasheet.ciiva.com/7849/1018594-7849882.pdf?src-supplier=Element14; ComponentLink5URL: https://datasheet.ciiva.com/16741/pyu-rc0402-51-rohs-l-6-r-16741081.pdf?src-supplier=Future+Electronics; ComponentLink5Description: https://datasheet.ciiva.com/16741/pyu-rc0402-51-rohs-l-6-r-16741081.pdf?src-supplier=Future+Electronics; LCSC Part Number: C138033
R27 = RT0402BRD077K68L: RES SMD 7.68KOHM 0.1% 1/16W 0402; Manufacturer: Yageo; Item Type: Resistors; Supplier: Mouser; LCSC Part Number: C852919; Manufacturer Part Number: RT0402BRD077K68L; RoHS: Yes; Stock: 6579; Pricing: 1=0.16, 10=0.121, 50=0.096, 100=0.086, 1000=0.061, 10000=0.038 (USD); ComponentLink1URL: https://datasheet.ciiva.com/12724/pyu-rt-1-to-0-05-rohs-l-4-12724831.pdf?src-supplier=Mouser; ComponentLink1Description: https://datasheet.ciiva.com/12724/pyu-rt-1-to-0-05-rohs-l-4-12724831.pdf?src-supplier=Mouser
R110 = RC0201FR-0710KL: RES SMD 10K OHM 1% 1/20W 0201; Manufacturer: Yageo; Item Type: Resistor; Manufacturer Part Number: RC0201FR-0710KL; ComponentLink7URL: https://www.lcsc.com/product-detail/Chip-Resistor-Surface-Mount_YAGEO-RC0201FR-0710KL_C106225.html; ComponentLink7Description: LCSC; LCSC Part Number: C106225; Package: 0201
R124 = RC0402FR-074K7L: RES 4.7K OHM 1% 1/16W 0402; Manufacturer: Yageo; Voltage Rating (DC): 50V; Power Rating: 62.5mW; Resistance: 4.7kR; Temperature Coefficient: 100ppm/°C; Max Power Dissipation: 63mW; Item Type: Resistor; Supplier 1: Avnet; Manufacturer Part Number: RC0402FR-074K7L; RoHS: Yes; Category: Chip SMD Resistors; Stock 1: 2420000; Pricing 1: 10000=0.00085 (USD); Case/Package: 0402; Number of Pins: 2; Case Code (Imperial): 0402; Case Code (Metric): 1005; Size Code: 0402; Min Operating Temperature: -55°C; Max Operating Temperature: 155°C; Tolerance: 1%; Voltage Rating: 50V; Packaging: Tape and Reel; Resistor Type: Thick Film; Termination: SMD/SMT; Features: Moisture Resistant; Series: RC; Number of Terminations: 2; Resistance Tolerance: 1%; Construction: Rectangular; Length: 1mm; Width: 0.5mm; Height: 0.32mm; Depth: 0.5mm; Height - Seated (Max): 0.016inch; RoHS Compliant: Yes; Reach SVHC Compliant: Yes; Military Standard: Not; Lead Free: Lead Free; ComponentLink1URL: https://datasheet.ciiva.com/22661/1686128-22661342.pdf?src-supplier=Element14; ComponentLink1Description: https://datasheet.ciiva.com/22661/1686128-22661342.pdf?src-supplier=Element14; ComponentLink2URL: https://datasheet.ciiva.com/7850/1018594-7850022.pdf?src-supplier=Element14; ComponentLink2Description: https://datasheet.ciiva.com/7850/1018594-7850022.pdf?src-supplier=Element14; ComponentLink3URL: https://datasheet.ciiva.com/7850/1018594-7850023.pdf?src-supplier=Element14; ComponentLink3Description: https://datasheet.ciiva.com/7850/1018594-7850023.pdf?src-supplier=Element14; ComponentLink4URL: https://datasheet.ciiva.com/15215/getdatasheetpartid-328119-15215035.pdf?src-supplier=Verical; ComponentLink4Description: https://datasheet.ciiva.com/15215/getdatasheetpartid-328119-15215035.pdf?src-supplier=Verical; Supplier Part Number 1: RC0402FR-074K7L; LCSC Part Number: C105871
R125 R126 = RC0402FR-070RL: as R28 on sheet eMMC_SPI-FLASH_SHEET; Supplier 1: Mouser; Manufacturer Part Number: RC0402FR-070RL; RoHS: Yes; Stock 1: 8556842; Pricing 1: 1=0.10000, 10=0.01400, 50=0.01400, 100=0.00600, 1000=0.00300, 5000=0.00200, 10000=0.00100 (USD); Mount: Surface Mount; Case/Package: 0402; Contact Plating: Tin,Matte; Case Code (Imperial): 0402; Case Code (Metric): 1005; Size Code: 0402; Min Operating Temperature: -55°C; Max Operating Temperature: 155°C; Resistor Type: Thick Film; Packaging: Tape and Reel; Termination: SMD/SMT; Features: Moisture Resistant; Series: RC; Number of Terminations: 2; Length: 1mm; Width: 0.5mm; Height: 0.35mm; Radiation Hardening: No; Lead Free: Lead Free; RoHS Compliant: Yes; ComponentLink1URL: https://datasheet.ciiva.com/8896/pyu-rc0402-51-rohs-l-6-8896149.pdf?src-supplier=Avnet; ComponentLink1Description: https://datasheet.ciiva.com/8896/pyu-rc0402-51-rohs-l-6-8896149.pdf?src-supplier=Avnet; ComponentLink2URL: https://datasheet.ciiva.com/16790/pyu-rc0402-51-rohs-l-6-r-16790444.pdf?src-supplier=Future+Electronics; ComponentLink2Description: https://datasheet.ciiva.com/16790/pyu-rc0402-51-rohs-l-6-r-16790444.pdf?src-supplier=Future+Electronics; Supplier Part Number 1: 603-RC0402FR-070RL; LCSC Part Number: C106231
TP10-TP12 TP14 = TEST POINT 0.5mm Dia: Test Point ON; Item Type: Test Point; Manufacturer Part Number: TEST POINT 0.5mm Dia
U4 = LT7911D: 5.4Gbps Type-C/DP/eDPToDual-port MIPI DSI/CSI/LVDS with Audio QFN-64(7.5x7.5) Video Interface ICs ROHS; Manufacturer: LONTIUM SEMICONDUCTOR; Item Type: IC; Manufacturer Part Number: LT7911D; Package: QFN-64(7.5x7.5); LCSC Part Number: C5310990; ComponentLink1Description: LCSC; ComponentLink1URL: https://jlcpcb.com/partdetail/LontiumSemiconductor-LT7911D/C5310990
X4 = NX2520SA-27MHZ-STD-CSW-5: SMD2520-4P Crystals ROHS; Manufacturer: NDK; Frequency: 32.768kHz; Frequency Tolerance: 20ppm; Load Capacitance: 6pF; ESR (Equivalent Series Resistance): 70kR; Supplier 1: Rs; Manufacturer Part Number: NX2520SA-27MHZ-STD-CSW-5; RoHS: Yes; Category: Crystals; Stock 1: 500; Pricing 1: 5=0.15520, 50=0.68600, 100=0.66600, 250=0.65000, 500=0.63400 (GBP); Mounting Technology: Surface Mount; Case/Package: SMD/SMT; Min Operating Temperature: -40°C; Max Operating Temperature: 85°C; Packaging: Cut Tape; Series: NX3215SA; RoHS Compliant: Yes; Supplier Part Number 1: 1847854; LCSC Part Number: C910047; Item Type: Crystal

## Sheet HDMI2.0_SHEET.SchDoc
size A4; SheetNumber: 21; SheetTotal: 23
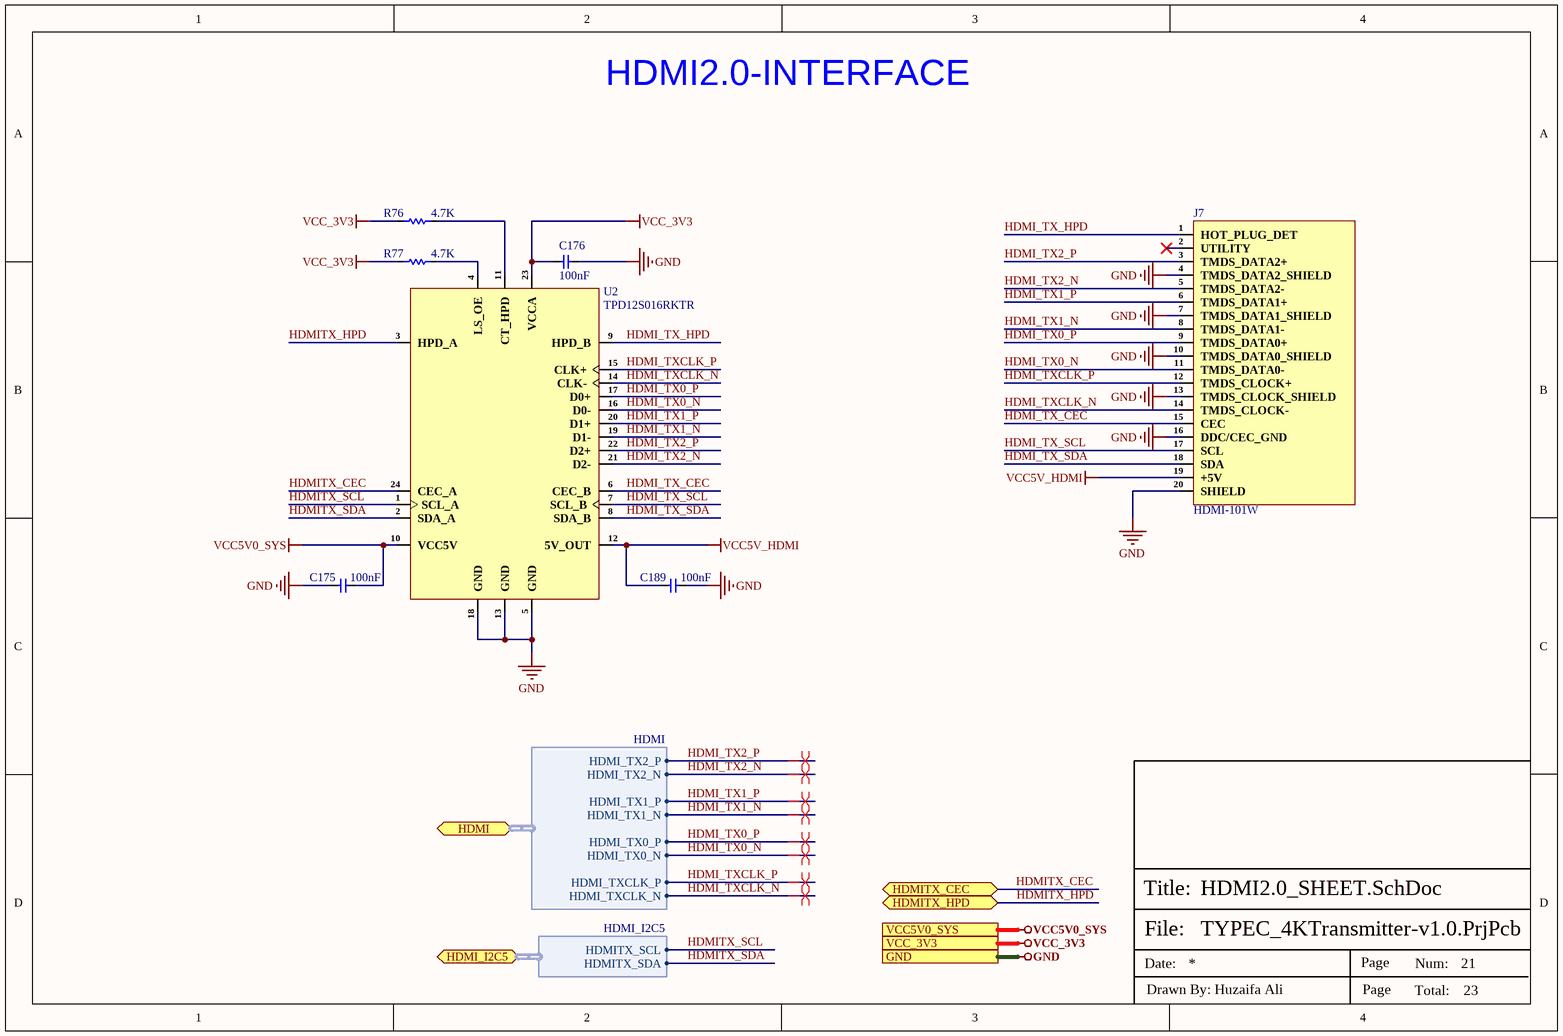
[diagram p21: HDMI2.0_SHEET.SchDoc]

### Parts
C175  100nF  [Cap-0402]
C176  100nF  [Cap-0402]
C189  100nF  [Cap-0402]
J7  HDMI-101W  [HDMI-101W]
R76  4.7K  [Res-0402]
R77  4.7K  [Res-0402]
U2  TPD12S016RKTR  [24-UQFN (4x2)]

### Ports
GND (see DRAM_LPDDR4_SHEET[6D], eMMC_SPI-FLASH_SHEET[1D], POWER_LDO_SHEET[3D], POWER_OTHER_SHEET[3C], POWER_PMIC_RK809_CODEC[3C], POWER_PMIC_RK809_DC DC[3D], POWER_PMIC_RK809_LDO[4C], POWER_PMIC_RK809_MGM[3D], RK3566_AUDIO_SHEET[3C], RK3566_DDR-PHY_SHEET[5D], RK3566_FLASH-SD_SHEET[4C], RK3566_OSC_PMUIO_SHEET[5D], RK3566_POWER_SHEET[3D], RK3566_SARADC_GPIO[3D], RK3566_USB_PCIe_SHEET[3D], RK3566_VI_SHEET[3D], RK3566_VO_SHEET_1[3C], RK3566_VO_SHEET_2[4C], TYPE-C_INTERFACE_SHEET[3D], TYPE-C_TO_MIPI-CSI_SHEET[5D], USB2.0_SHEET[3D], WIFI-6_SHEET[3D]), HDMI (bidir, harness HDMI, see RK3566_VO_SHEET_1[2C]), HDMI_I2C5 (bidir, harness HDMI_I2C5, see RK3566_AUDIO_SHEET[3B]), HDMITX_CEC (bidir, see RK3566_AUDIO_SHEET[3C]), HDMITX_HPD (bidir, see RK3566_VO_SHEET_1[3C]), VCC5V0_SYS (see POWER_LDO_SHEET[3D], POWER_OTHER_SHEET[3C], POWER_PMIC_RK809_CODEC[3C], POWER_PMIC_RK809_MGM[3D], RK3566_USB_PCIe_SHEET[3C], TYPE-C_INTERFACE_SHEET[3D], USB2.0_SHEET[3D]), VCC_3V3 (see eMMC_SPI-FLASH_SHEET[1D], POWER_PMIC_RK809_LDO[4C], RK3566_AUDIO_SHEET[3C], RK3566_SARADC_GPIO[3D], RK3566_USB_PCIe_SHEET[3D], RK3566_VI_SHEET[3D], RK3566_VO_SHEET_2[4C], TYPE-C_TO_MIPI-CSI_SHEET[5D], WIFI-6_SHEET[3D])

### Harnesses
HDMI_I2C5: HDMITX_SCL, HDMITX_SDA
HDMI: HDMI_TX2_P, HDMI_TX2_N, HDMI_TX1_P, HDMI_TX1_N, HDMI_TX0_P, HDMI_TX0_N, HDMI_TXCLK_P, HDMI_TXCLK_N

### Nets
GND: C175.2 C176.1 C189.2 J7.4(TMDS_DATA2_SHIELD) J7.7(TMDS_DATA1_SHIELD) J7.10(TMDS_DATA0_SHIELD) J7.13(TMDS_CLOCK_SHIELD) J7.16(DDC/CEC_GND) J7.20(SHIELD) U2.5(GND) U2.13(GND) U2.18(GND) ; port GND
VCC5V0_SYS: C175.1 U2.10(VCC5V) ; port VCC5V0_SYS
VCC5V_HDMI: C189.1 J7.19(+5V) U2.12(5V_OUT)
VCC_3V3: C176.2 R76.2 R77.2 U2.23(VCCA) ; port VCC_3V3
HDMI_TX0_N: J7.11(TMDS_DATA0-) U2.16(D0-) ; port HDMI.HDMI_TX0_N
HDMI_TX0_P: J7.9(TMDS_DATA0+) U2.17(D0+) ; port HDMI.HDMI_TX0_P
HDMI_TX1_N: J7.8(TMDS_DATA1-) U2.19(D1-) ; port HDMI.HDMI_TX1_N
HDMI_TX1_P: J7.6(TMDS_DATA1+) U2.20(D1+) ; port HDMI.HDMI_TX1_P
HDMI_TX2_N: J7.5(TMDS_DATA2-) U2.21(D2-) ; port HDMI.HDMI_TX2_N
HDMI_TX2_P: J7.3(TMDS_DATA2+) U2.22(D2+) ; port HDMI.HDMI_TX2_P
HDMI_TX_CEC: J7.15(CEC) U2.6(CEC_B)
HDMI_TX_HPD: J7.1(HOT_PLUG_DET) U2.9(HPD_B)
HDMI_TX_SCL: J7.17(SCL) U2.7(SCL_B)
HDMI_TX_SDA: J7.18(SDA) U2.8(SDA_B)
HDMI_TXCLK_N: J7.14(TMDS_CLOCK-) U2.14(CLK-) ; port HDMI.HDMI_TXCLK_N
HDMI_TXCLK_P: J7.12(TMDS_CLOCK+) U2.15(CLK+) ; port HDMI.HDMI_TXCLK_P
HDMITX_CEC: U2.24(CEC_A) ; port HDMITX_CEC
HDMITX_HPD: U2.3(HPD_A) ; port HDMITX_HPD
HDMITX_SCL: U2.1(SCL_A) ; port HDMI_I2C5.HDMITX_SCL
HDMITX_SDA: U2.2(SDA_A) ; port HDMI_I2C5.HDMITX_SDA
NetR76_1: R76.1 U2.11(CT_HPD)
NetR77_1: R77.1 U2.4(LS_OE)

Not connected (* = marked no-connect by the designer): J7 2(UTILITY)*

### Layout directives
differential pair; differential pair class HDMI_100R: HDMI_TX0_N, HDMI_TX0_P, HDMI_TX1_N, HDMI_TX1_P, HDMI_TX2_N, HDMI_TX2_P, HDMI_TXCLK_N, HDMI_TXCLK_P

### Notes on the sheet
- HDMI2.0-INTERFACE
- File:
- Title:
- Date:
- Page
- Num:
- Total:
- Drawn By: Huzaifa Ali

### Library data of the parts
C175 C176 C189 = CC0402KRX5R7BB104: CAP CER 0.1UF 16V X5R 0402; Manufacturer: Yageo; Tolerance: 10%; Manufacturer Part Number: CC0402KRX5R7BB104; RoHS: Yes; Category: Ceramic Capacitors; Supplier 1: Mouser; Stock 1: 936792; Pricing 1: 1=0.10000, 10=0.02300, 50=0.02300, 100=0.01100, 1000=0.00600, 10000=0.00400 (USD); Mount: Surface Mount; Case/Package: 0402; Number of Pins: 2; Case Code (Metric): 1005; Case Code (Imperial): 0402; Min Operating Temperature: -55°C; Max Operating Temperature: 85°C; Capacitance: 100nF; Dielectric: X5R; Packaging: Tape and Reel; Voltage Rating: 16V; Package Quantity: 1; Voltage Rating (DC): 16V; Termination: SMD/SMT; Resistor Type: Ceramic; Series: CC; Construction: Flat; Length: 1mm; Width: 0.02inch; Height: 0.5mm; Thickness: 0.022inch; Depth: 0.5mm; Radiation Hardening: No; REACH SVHC: Unknown; Lead Free: Lead Free; Halogen Free: Halogen Free; RoHS Compliant: Yes; ComponentLink1URL: https://datasheet.ciiva.com/155/mlccorderingcode-155879.pdf?src-supplier=Digi-Key; ComponentLink1Description: https://datasheet.ciiva.com/155/mlccorderingcode-155879.pdf?src-supplier=Digi-Key; ComponentLink2URL: https://datasheet.ciiva.com/155/mlccorderingcode-155878.pdf?src-supplier=Digi-Key; ComponentLink2Description: https://datasheet.ciiva.com/155/mlccorderingcode-155878.pdf?src-supplier=Digi-Key; ComponentLink3URL: https://datasheet.ciiva.com/155/mlccorderingcode-155880.pdf?src-supplier=Digi-Key; ComponentLink3Description: https://datasheet.ciiva.com/155/mlccorderingcode-155880.pdf?src-supplier=Digi-Key; ComponentLink4URL: https://datasheet.ciiva.com/11464/upy-gphc-x5r-4v-to-50v-12-11464869.pdf?src-supplier=Avnet; ComponentLink4Description: https://datasheet.ciiva.com/11464/upy-gphc-x5r-4v-to-50v-12-11464869.pdf?src-supplier=Avnet; Supplier Part Number 1: 603-CC402KRX5R7BB104; LCSC Part Number: C106204
J7 = HDMI-101W: SMD HDMI Connectors ROHS; Manufacturer: XUNPU; Manufacturer Part Number: HDMI-101W; Package: SMD; LCSC Part Number: C720619; Item Type: Connector; ComponentLink1Description: LCSC; ComponentLink1URL: https://www.lcsc.com/product-detail/HDMI-Connectors_XUNPU-HDMI-101W_C720619.html
R76 R77 = RC0402FR-074K7L: RES 4.7K OHM 1% 1/16W 0402; Manufacturer: Yageo; Max Power Dissipation: 63mW; Temperature Coefficient: 100ppm/°C; Resistance: 4.7kR; Voltage Rating (DC): 50V; Power Rating: 62.5mW; Item Type: Resistor; Manufacturer Part Number: RC0402FR-074K7L; RoHS: Yes; Category: Chip SMD Resistors; Case/Package: 0402; Case Code (Imperial): 0402; Case Code (Metric): 1005; Min Operating Temperature: -55°C; Max Operating Temperature: 155°C; Features: Moisture Resistant; Packaging: Tape and Reel; Tolerance: 1%; Number of Terminations: 2; Series: RC; RoHS Compliant: Yes; ComponentLink1URL: https://datasheet.ciiva.com/22661/1686128-22661342.pdf?src-supplier=Element14; ComponentLink1Description: https://datasheet.ciiva.com/22661/1686128-22661342.pdf?src-supplier=Element14; Supplier 1: Avnet; Stock 1: 2420000; Pricing 1: 10000=0.00085 (USD); Number of Pins: 2; Resistor Type: Thick Film; Voltage Rating: 50V; Termination: SMD/SMT; Resistance Tolerance: 1%; Construction: Rectangular; Length: 1mm; Width: 0.5mm; Height: 0.32mm; Depth: 0.5mm; Lead Free: Lead Free; Military Standard: Not; ComponentLink2URL: https://datasheet.ciiva.com/7850/1018594-7850022.pdf?src-supplier=Element14; ComponentLink2Description: https://datasheet.ciiva.com/7850/1018594-7850022.pdf?src-supplier=Element14; ComponentLink3URL: https://datasheet.ciiva.com/7850/1018594-7850023.pdf?src-supplier=Element14; ComponentLink3Description: https://datasheet.ciiva.com/7850/1018594-7850023.pdf?src-supplier=Element14; ComponentLink4URL: https://datasheet.ciiva.com/15215/getdatasheetpartid-328119-15215035.pdf?src-supplier=Verical; ComponentLink4Description: https://datasheet.ciiva.com/15215/getdatasheetpartid-328119-15215035.pdf?src-supplier=Verical; Supplier Part Number 1: RC0402FR-074K7L; LCSC Part Number: C105871; Size Code: 0402; Height - Seated (Max): 0.016inch; Reach SVHC Compliant: Yes
U2 = TPD12S016RKTR: IC INTERFACE SPECIALIZED 24UQFN; Manufacturer: Texas Instruments; Supplier: Mouser; Supplier Part Number: 595-TPD12S016RKTR; Manufacturer Part Number: TPD12S016RKTR; RoHS: Yes; Category: Interface ICs; Stock: 5223; Pricing: 1=0.82, 10=0.694, 50=0.694, 100=0.537, 1000=0.443, 10000=0.442 (USD); ComponentLink1URL: https://datasheet.ciiva.com/12545/tpd12s016-108314-12545332.pdf?src-supplier=Mouser; ComponentLink1Description: https://datasheet.ciiva.com/12545/tpd12s016-108314-12545332.pdf?src-supplier=Mouser; ComponentLink2URL: https://datasheet.ciiva.com/14195/tpd12s016-14195158.pdf?src-supplier=Avnet; ComponentLink2Description: https://datasheet.ciiva.com/14195/tpd12s016-14195158.pdf?src-supplier=Avnet; ComponentLink3URL: https://datasheet.ciiva.com/6632/tpd12s016-6632086.pdf?src-supplier=Digikey; ComponentLink3Description: https://datasheet.ciiva.com/6632/tpd12s016-6632086.pdf?src-supplier=Digikey